# Altium schematic sheet DAC.SchDoc
size B; SheetNumber: 4; SheetTotal: 6
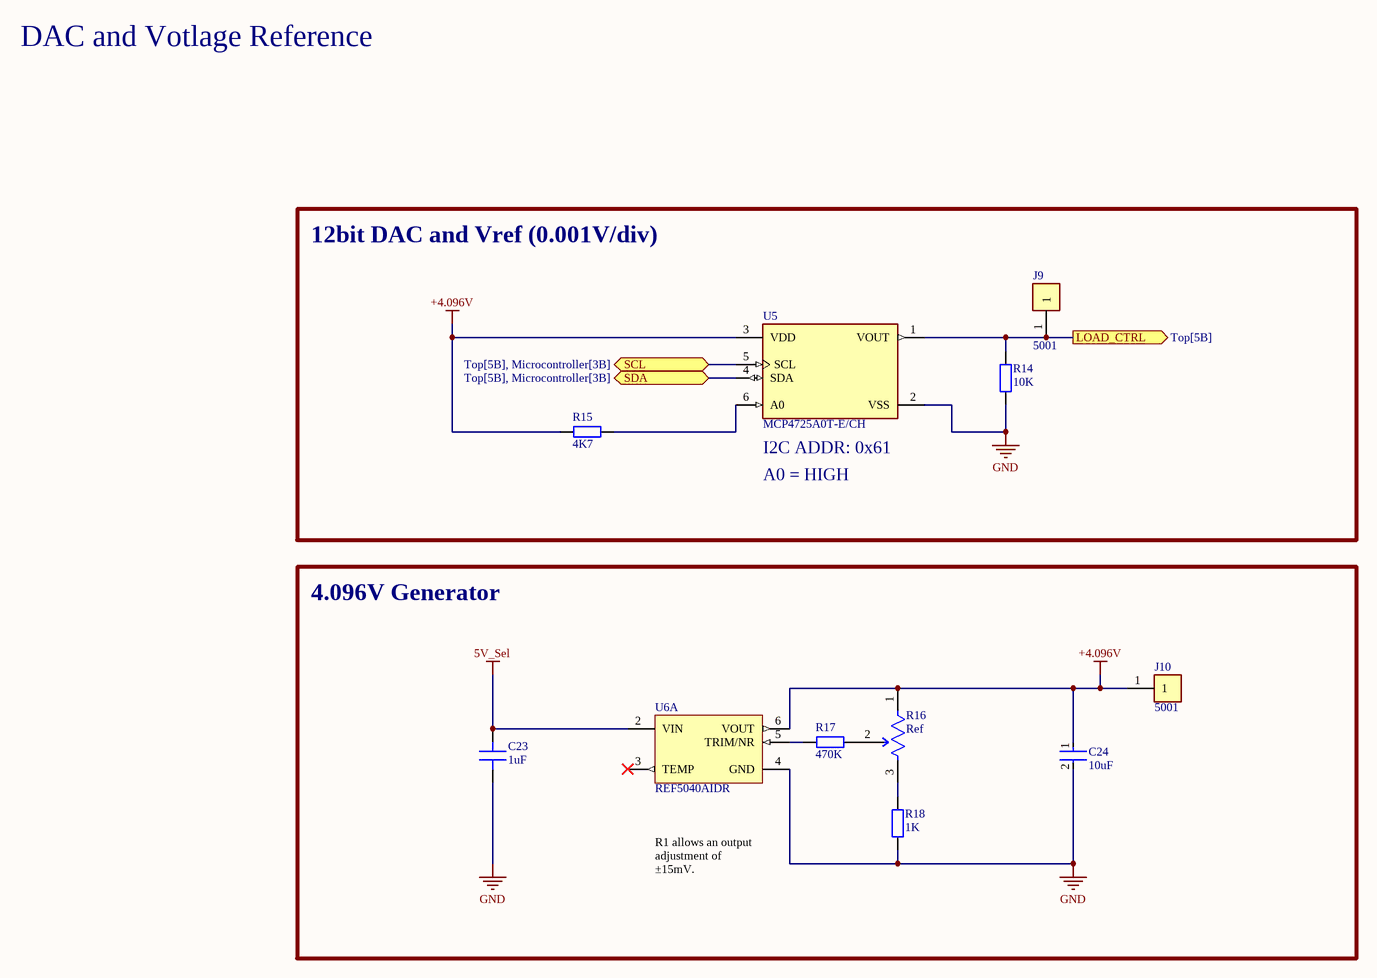
[diagram p0: DAC.SchDoc]

## Parts
C23  1uF  [IPC C C0603 NO SILK]
C24  10uF  [FP-GRM21B-0_1-IPC_C]
J9  5001  [FP-5001-MFG]
J10  5001  [FP-5001-MFG]
R14  10K  [IPC C R0402 NO SILK]
R15  4K7  [IPC C R0402 NO SILK]
R16  Ref  [FP-3296Y-MFG]
R17  470K  [IPC C R0603 NO SILK]
R18  1K  [IPC C R0402 NO SILK]
U5  MCP4725A0T-E/CH  [FP-C04-028-CHY-IPC_A]
U6  REF5040AIDR  [D0008A_M]  (part A of 2)

## Blocks framed on the sheet
12bit DAC and Vref (0.001V/div): J9 R14 R15 U5
4.096V Generator: C23 C24 J10 R16-R18 U6

## Ports
LOAD_CTRL (out, see Top[5B]), SCL (bidir, see Top[5B], Microcontroller[3B]), SDA (bidir, see Top[5B], Microcontroller[3B])

## Nets
5V_Sel: C23.2 U6.2(VIN)
+4.096V: C24.1 J10.1 R15.2 R16.1(CCW) U5.3(VDD) U6.6(VOUT)
GND: C23.1 C24.2 R14.1 R18.1 U5.2(VSS) U6.4(GND)
LOAD_CTRL: J9.1 R14.2 U5.1(VOUT) ; port LOAD_CTRL
SCL: U5.5(SCL) ; port SCL
SDA: U5.4(SDA) ; port SDA
NetR15_1: R15.1 U5.6(A0)
NetR16_2: R16.2(WIPER) R17.2
NetR16_3: R16.3(CW) R18.2
NetR17_1: R17.1 U6.5(TRIM/NR)

Not connected (* = marked no-connect by the designer): U6 3(TEMP)*

## Notes on the sheet
- DAC and Votlage Reference
- (near U5) I2C ADDR: 0x61
- A0 = HIGH
- R1 allows an output adjustment of ±15mV.

## Library data of the parts
C23 = CMP-002-000001-1: Source: Schlib1.SchLib; Design Item ID: Generic CAP 0603; Value: 1uF
C24 = CMP-2007-03453-2: GRM21BR61C106KE15L; Chip Multilayer Ceramic Capacitors for General Purpose, 0805, 10uF, X5R, 15%, 10%, 16V; Radiation Hardening: No; Thickness: 0.053inch; Voltage Rating (DC): 16V; Lead Free: Lead Free; Package Quantity: 1; Width: 1.25mm; Case Code (Imperial): 0805; Depth: 1.25mm; Packaging: Tape and Reel; Dielectric: X5R; Max Operating Temperature: 85°C; Tolerance: 10%; Voltage Rating: 16V; Voltage: 16V; Capacitance: 10uF; Height: 1.25mm; Case Code (Metric): 2012; Material: Ceramic; Mount: Surface Mount; Case/Package: 0805; REACH SVHC: No SVHC; Length: 2mm; Min Operating Temperature: -55°C; Termination: SMD/SMT
J9 J10 = CMP-2000-05181-2: PC TEST POINT MINIATURE BLACK; Body Material: Bronze; Plating: Silver; Inside Diameter: 1.27mm; Hole Diameter: 1.6mm; Number of Ports: 1; Outside Diameter: 2.54mm; Insulation: Insulated; Insulation Material: Nylon; Mount: Through Hole; RoHS Compliant: Yes; Series: THM; Height: 0.3inch; Termination: Through Hole; Material: Nylon; Packaging: Bulk; Contact Material: Bronze; REACH SVHC: No SVHC; Contact Plating: Silver; Orientation: Straight; Lead Free: Lead Free; Package Quantity: 100; Length: 7.62mm; Flammability Rating: UL94 V-0; Number of Contacts: 1; Diameter: 2.54mm; Housing Color: Black; Color: Black
R14 R15 R18 = CMP-008-000000-1: Source: Schlib1.SchLib; Design Item ID: Generic RES 0402
  R14: Value: 10K
  R15: Value: 4K7
  R18: Value: 1K
R16 = CMP-07234-000015-2: TRIMMER 10K OHM 0.5W PC PIN TOP; Manufacturer Series: 3296; Actuator Orientation: Vertical; Power Rating: 500mW; Temperature Coefficient: 100ppm/°C; Resistance Tolerance: 10%; Resistance Law: Linear; Number of Turns: 25; Actuator Type: SCREW; Number of Terminals/Pins: 3; Insulation Resistance: 1GR; Resistance: 10k; Military Standard: Not; REACH SVHC: No SVHC; Lead Free: Lead Free; Resistor Type: Cermet; Max Operating Temperature: 125°C; Radiation Hardening: No; Package Quantity: 50; Mount: Panel; Max Power Dissipation: 500mW; Min Operating Temperature: -55°C; Type: Potentiometer; Terminal Finish: Tin; Termination: Pin; Taper: Linear; Color: Blue; Technology: CERMET; Packaging: Rail/Tube; Weight: 0.03oz; Height: 0.395inch; Number of Pins: 3; RoHS Compliant: Yes; Width: 9.53mm; Tolerance: 10%; Depth: 4.83mm; Series: 3296; Length: 9.53mm
R17 = CMP-008-000001-1: Value: 470K; Source: Schlib1.SchLib; Design Item ID: Generic RES 0603
U5 = CMP-0188-00760-3: IC DAC 12BIT V-OUT SOT23-6; Number of Outputs: 1; Supply Type: Single; Integral Nonlinearity (INL): 14.5LSB; Polarity: Unipolar; Number of Bits: 12; Min Supply Voltage: 2.7V; Output Type: Voltage; Settling Time: 6us; Max Supply Voltage: 5.5V; Nominal Supply Current: 210uA; Resolution: 12b; Interface: I2C; Input Offset Voltage (Vos): 1.1mV; Radiation Hardening: No; Number of DAC Channels: 1; Length: 3.1mm; Number of D/A Converters: 1; Number of Pins: 6; Case/Package: SOT-23-6; Lead Free: Lead Free; Number of Channels: 1; Termination: SMD/SMT; Width: 1.8mm; Contact Plating: Tin; Package Quantity: 3000; Max Operating Temperature: 125°C; Min Operating Temperature: -40°C; REACH SVHC: No SVHC; Mount: Surface Mount; Height: 1.3mm; Packaging: Tape and Reel; Number of Converters: 1
U6 = CMP-0367-00019-2: Low Noise, Very Low Drift, Precision Voltage Reference, -40 to 125 degC, 8-pin SOIC (D), Green (RoHS & no Sb/Br); Manufacturer: Texas Instruments; Initial Accuracy @ 25/deg C(%): 0.05; VO(V): 4.096; VI(Max)(V): 18; Temp Coeff(Max)(ppm/ degree C): 3; Iq(Max)(uA): 1000; VI(Min)(V): 4.296; Rating: Catalog; SubFamily: Series Voltage Reference; Iout/Iz(Max)(mA): 10; PartNumber: REF5040AIDR; Code_JEDEC: MS-012; PackageReference: D0008A; PackageDescription: 8-Pin Plastic Small Outline, Body 4.9 x 3.9 mm, Pitch 1.27 mm; ComponentLink3Description: Package Specification; Mounting Technology: Surface Mount; ComponentLink2Description: Datasheet; PackageVersion: 4040047-3/M; ComponentLink1URL: http://www.ti.com/; ComponentLink1Description: Manufacturer URL; ComponentLink2URL: http://www.ti.com/general/docs/lit/getliterature.tsp?genericPartNumber=REF5040&fileType=pdf; ComponentLink3URL: http://www.ti.com/litv/pdf/msoi002j; Eco-Plan: Green (RoHS & no Sb/Br); DatasheetVersion: SBOS410E